# Altium project Projekt_E.PrjPcb
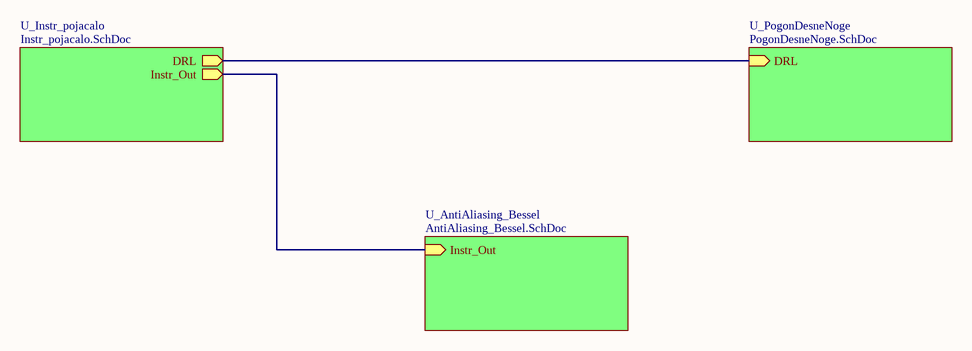
[diagram p0: Top.SchDoc]
4 sheets, 37 parts. Net scope: hierarchical (ports join the sheet entries above them; power ports are global).
Board file: PCB1.PcbDoc
Sheets:
  Top.SchDoc
    U_Instr_pojacalo = Instr_pojacalo.SchDoc
    U_PogonDesneNoge = PogonDesneNoge.SchDoc
    U_AntiAliasing_Bessel = AntiAliasing_Bessel.SchDoc

## Sheet Top.SchDoc
size A4; SheetNumber: 1; SheetTotal: 4

### Sub-sheets
U_AntiAliasing_Bessel = AntiAliasing_Bessel.SchDoc: Instr_Out (in)
U_Instr_pojacalo = Instr_pojacalo.SchDoc: DRL (out), Instr_Out (out)
U_PogonDesneNoge = PogonDesneNoge.SchDoc: DRL (in)

### Nets
NetC6_1: sheet U_Instr_pojacalo/Instr_Out, sheet U_AntiAliasing_Bessel/Instr_Out
NetR3_2: sheet U_Instr_pojacalo/DRL, sheet U_PogonDesneNoge/DRL

## Sheet Instr_pojacalo.SchDoc
size A4; SheetNumber: 2; SheetTotal: 4
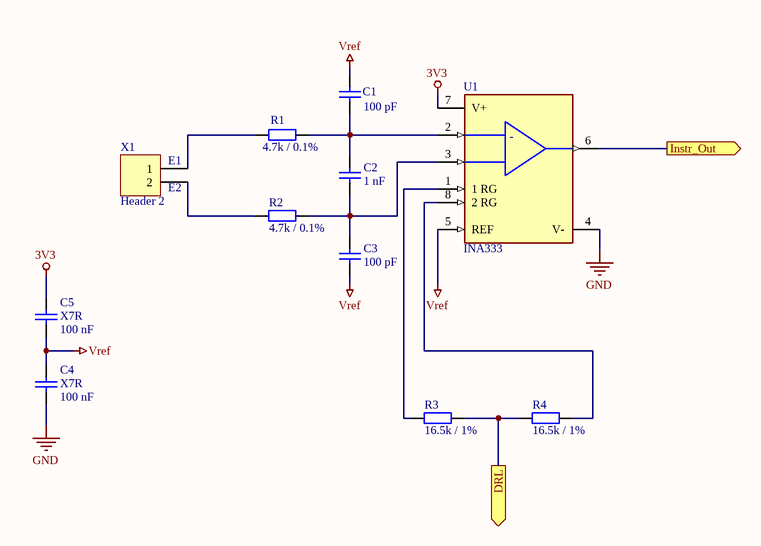
[diagram p1: Instr_pojacalo.SchDoc]

### Parts
C1  100 pF  [C0805]
C2  1 nF  [C0805]
C3  100 pF  [C0805]
C4  X7R  value 100 nF  [C0805]
C5  X7R  value 100 nF  [C0805]
R1  4.7k / 0.1%  [6-0805_N]
R2  4.7k / 0.1%  [6-0805_N]
R3  16.5k / 1%  [6-0805_N]
R4  16.5k / 1%  [6-0805_N]
U1  INA333  [FP-DGK0008A-MFG]
X1  Header 2  [HDR1X2]

### Ports
DRL (out, see Top[1B], PogonDesneNoge[1A]), Instr_Out (out, see Top[1B], AntiAliasing_Bessel[1B])

### Nets
3V3: C5.2 U1.7(V+)
GND: C4.1 U1.4(V-)
Vref: C1.2 C3.1 C4.2 C5.1 U1.5(REF)
NetC1_1: C1.1 C2.2 R1.2 U1.2(VIN-)
NetC2_1: C2.1 C3.2 R2.2 U1.3(VIN+)
NetC6_1: U1.6(VOUT) ; port Instr_Out
NetR1_1: R1.1 X1.1
NetR2_1: R2.1 X1.2
NetR3_1: R3.1 U1.1(1_RG)
NetR3_2: R3.2 R4.1 ; port DRL
NetR4_2: R4.2 U1.8(2_RG)

### Notes on the sheet
- (near X1) E1
- (near X1) E2
- (in symbol CMP-0944-00090-3) -

### Library data of the parts
C1 C3 = Cap: Capacitor; Proizvođač: Murata Electronics; Kataloški broj: GRM2165C1H101JA01D; Cijena: 0,10 €; Kućište: 0805; Opis: Keramički kondenzator, 100 pF, 50V, C0G; Value: 100 pF
C2 = Cap: Capacitor; Proizvođač: Murata Electronics; Kataloški broj: GRM2165C1H102JA01D; Cijena: 0,13 €; Kućište: 0805; Opis: Keramički kondenzator, 1 nF, 50V, C0G; Value: 1 nF
C4 C5 = Cap: Capacitor; Proizvođač: Murata Electronics; Kataloški broj: GCM21BR71H104KA37L; Cijena: 0,28 €; Kućište: 0805; Opis: Keramički kondenzator, 100 nF, 50V, X7R
R1 R2 = Res2: Resistor; Proizvođač: Panasonic; Kataloški broj: ERA-6AEB472V; Cijena: 0,09 €; Kućište: 0805; Opis: Precizni otpornik, 4.7 k, 0.1%; Value: 4.7k / 0.1%
R3 R4 = Res2: Resistor; Proizvođač: Vishay; Kataloški broj: CRCW080516K5FKEA; Cijena: 0,09 €; Kućište: 0805; Opis: Otpornik, 16.5 k, 1%; Value: 16.5k / 1%
U1 = CMP-0944-00090-3: IC INST AMP 1 CIRCUIT 8VSSOP; Proizvođač: Texas Instruments; Kataloški broj: INA333AIDGKT; Cijena: 4,87 €; Kućište: VSSOP-8; Opis: Instrumentacijsko pojačalo
X1 = Header 2: Header, 2-Pin; Proizvođač: Molex; Kataloški broj: 90120-0122; Cijena: 0,34 €; Kućište: THT Pin Header 2.54mm; Opis: Muški konektor 1x2, 2.54mm

## Sheet PogonDesneNoge.SchDoc
size A4; SheetNumber: 4; SheetTotal: 4
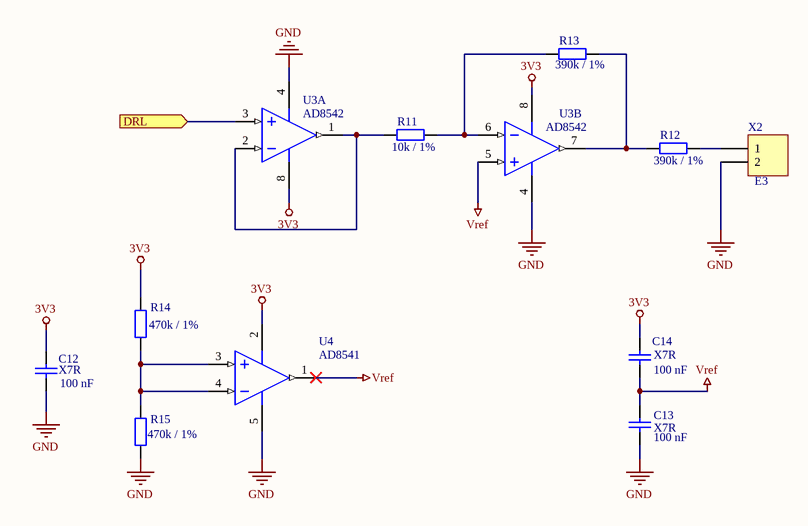
[diagram p2: PogonDesneNoge.SchDoc]

### Parts
C12  X7R  value 100 nF  [C0805]
C13  X7R  value 100 nF  [C0805]
C14  X7R  value 100 nF  [C0805]
R11  10k / 1%  [6-0805_N]
R12  390k / 1%  [6-0805_N]
R13  390k / 1%  [6-0805_N]
R14  470k / 1%  [6-0805_N]
R15  470k / 1%  [6-0805_N]
U3  AD8542  [ADI-R-8_M]  (parts A,B of 2)
U4  AD8541  [ADI-RJ-5_N]
X2  Header 2  [HDR1X2]  (value not drawn)

### Ports
DRL (in, see Top[3B], Instr_pojacalo[3D])

### Nets
3V3: C12.2 C14.2 R14.2 U3.8(+V) U4.2(-V)
GND: C12.1 C13.1 R15.1 U3.4(-V) U4.5(+V) X2.2
Vref: C13.2 C14.1 U3.5(+IN_B) U4.1(OUT_A)
NetR3_2: U3.3(+IN_A) ; port DRL
NetR11_1: R11.1 R13.1 U3.6(-IN_B)
NetR11_2: R11.2 U3.1(OUT_A) U3.2(-IN_A)
NetR12_1: R12.1 X2.1
NetR12_2: R12.2 R13.2 U3.7(OUT_B)
NetR14_1: R14.1 R15.2 U4.3(+IN_A) U4.4(-IN_A)

### Notes on the sheet
- (near X2) E3

### Library data of the parts
C12-C14 = Cap: as C4 on sheet Instr_pojacalo
R11 = Res2: Resistor; Proizvođač: Vishay; Kataloški broj: CRCW080510K0FKEA; Cijena: 0,09 €; Kućište: 0805; Opis: Otpornik, 10 k, 1%; Value: 10k / 1%
R12 R13 = Res2: Resistor; Proizvođač: Vishay; Kataloški broj: CRCW0805390KFKEA; Cijena: 0,09 €; Kućište: 0805; Opis: Otpornik, 390 k, 1%; Value: 390k / 1%
R14 R15 = Res2: Resistor; Proizvođač: Vishay; Kataloški broj: CRCW0805470KFKEA; Cijena: 0,09 €; Kućište: 0805; Opis: Otpornik, 470 k, 1%; Value: 470k / 1%
U3 = CMP-0384-00597-1: Double Channel RRIO Operational Amplifier, 1 MHz BW, 920 mV/us SR, Industrial, 8-pin SOIC (R-8), Tube; Proizvođač: Analog Devices; Kataloški broj: AD8542ARZ; Cijena: 1,31 €; Kućište: SOIC-8; Opis: Dvostruko operacijsko pojačalo
U4 = CMP-0384-01498-2: Single Channel RRIO Operational Amplifier, 1 MHz BW, 920 mV/us SR, Industrial, 5-pin SOT23 (RJ-5), Reel; Proizvođač: Analog Devices; Kataloški broj: AD8541ARTZ-REEL7; Cijena: 1,83 €; Kućište: SOT-23-5; Opis: Operacijsko pojačalo
X2 = CMP-002-00141-1: Header, 2-Pin; Signal Integrity: Connector; Proizvođač: Molex; Kataloški broj: 90120-0122; Cijena: 0,34 €; Kućište: THT Pin Header 2.54mm; Opis: Muški konektor 1x2, 2.54mm

## Sheet AntiAliasing_Bessel.SchDoc
size A4; SheetNumber: 3; SheetTotal: 4
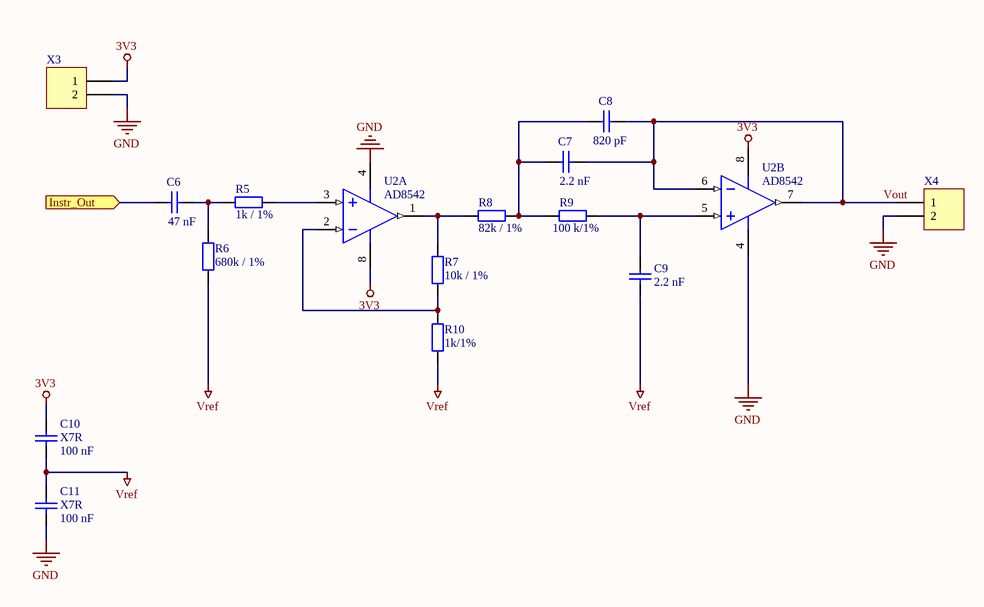
[diagram p3: AntiAliasing_Bessel.SchDoc]

### Parts
C6  47 nF  [C0805]
C7  2.2 nF  [C0805]
C8  820 pF  [C0805]
C9  2.2 nF  [C0805]
C10  X7R  value 100 nF  [C0805]
C11  X7R  value 100 nF  [C0805]
R5  1k / 1%  [6-0805_N]
R6  680k / 1%  [6-0805_N]
R7  10k / 1%  [6-0805_N]
R8  82k / 1%  [6-0805_N]
R9  100 k/1%  [6-0805_N]
R10  1k/1%  [6-0805_N]
U2  AD8542  [ADI-R-8_M]  (parts A,B of 2)
X3  Header 2  [HDR1X2]  (value not drawn)
X4  Header 2  [HDR1X2]  (value not drawn)

### Ports
Instr_Out (in, see Top[2C], Instr_pojacalo[3B])

### Nets
3V3: C10.2 U2.8(+V) X3.1
GND: C11.1 U2.4(-V) X3.2 X4.2
Vref: C9.1 C10.1 C11.2 R6.1 R10.1
Vout: C7.1 C8.1 U2.6(-IN_B) U2.7(OUT_B) X4.1
NetC6_1: C6.1 ; port Instr_Out
NetC6_2: C6.2 R5.1 R6.2
NetC7_2: C7.2 C8.2 R8.2 R9.1
NetC9_2: C9.2 R9.2 U2.5(+IN_B)
NetR5_2: R5.2 U2.3(+IN_A)
NetR7_1: R7.1 R10.2 U2.2(-IN_A)
NetR7_2: R7.2 R8.1 U2.1(OUT_A)

### Library data of the parts
C6 = Cap: Capacitor; Proizvođač: KEMET; Kataloški broj: C0805C473M3GECAUTO7210; Cijena: 0,34 €; Kućište: 0805; Opis: Keramički kondenzator, 47 nF, 25V, C0G; Value: 47 nF
C7 C9 = Cap: Capacitor; Proizvođač: Murata Electronics; Kataloški broj: GRM2165C1H222JA01D; Cijena: 0,16 €; Kućište: 0805; Opis: Keramički kondenzator, 2.2 nF, 50V, C0G; Value: 2.2 nF
C8 = Cap: Capacitor; Proizvođač: Murata Electronics; Kataloški broj: GRM2165C1H821JA01D; Cijena: 0,18 €; Kućište: 0805; Opis: Keramički kondenzator, 820 pF, 50V, C0G; Value: 820 pF
C10 C11 = Cap: as C4 on sheet Instr_pojacalo
R5 = Res2: Resistor; Proizvođač: Vishay; Kataloški broj: CRCW08051K00FKEA; Cijena: 0,09 €; Kućište: 0805; Opis: Otpornik, 1 k, 1%; Value: 1k / 1%
R6 = Res2: Resistor; Proizvođač: Vishay; Kataloški broj: CRCW0805680KFKEA; Cijena: 0,09 €; Kućište: 0805; Opis: Otpornik, 680 k, 1%; Value: 680k / 1%
R7 = Res2: as R11 on sheet PogonDesneNoge; Value: 10k / 1%
R8 = Res2: Resistor; Proizvođač: Vishay; Kataloški broj: CRCW080582K0FKEA; Cijena: 0,09 €; Kućište: 0805; Opis: Otpornik, 82 k, 1%; Value: 82k / 1%
R9 = Res2: Resistor; Proizvođač: Vishay; Kataloški broj: CRCW0805100KFKEA; Cijena: 0,10 €; Kućište: 0805; Opis: Otpornik, 100 k, 1%; Value: 100 k/1%
R10 = Res2: Resistor; Proizvođač: Vishay; Kataloški broj: CRCW080510K0FKEA; Cijena: 0,09 €; Kućište: 0805; Opis: Otpornik, 10 k, 1%; Value: 10k / 1%
U2 = CMP-0384-00597-1: as U3 on sheet PogonDesneNoge
X3 X4 = Header 2: as X1 on sheet Instr_pojacalo

## Nets that join several sheets
3V3: Instr_pojacalo (C5.2 U1.7), PogonDesneNoge (5 pins), AntiAliasing_Bessel (C10.2 U2.8 X3.1)
GND: Instr_pojacalo (C4.1 U1.4), PogonDesneNoge (6 pins), AntiAliasing_Bessel (C11.1 U2.4 X3.2 X4.2)
Vref: Instr_pojacalo (5 pins), PogonDesneNoge (C13.2 C14.1 U3.5 U4.1), AntiAliasing_Bessel (5 pins)
NetC6_1: Instr_pojacalo (U1.6), AntiAliasing_Bessel (C6.1)
NetR3_2: Instr_pojacalo (R3.2 R4.1), PogonDesneNoge (U3.3)